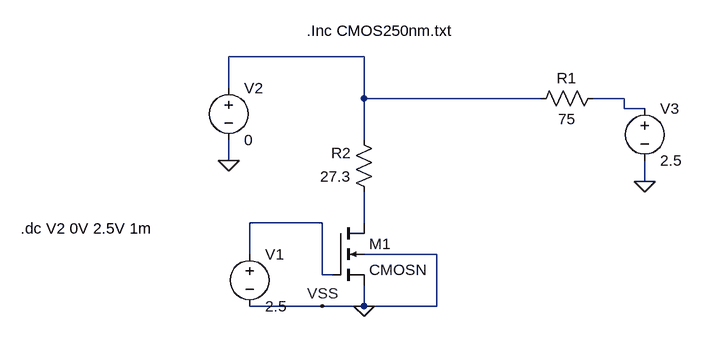
[diagram p0: schematic Draft4.asc]
Draft4.asc, the LTspice schematic file:
Version 4.1
SHEET 1 1112 680
WIRE 400 -32 192 -32
WIRE 192 16 192 -32
WIRE 400 32 400 -32
WIRE 672 32 400 32
WIRE 800 32 752 32
WIRE 800 48 800 32
WIRE 832 48 800 48
WIRE 400 96 400 32
WIRE 192 128 192 96
WIRE 832 160 832 128
WIRE 336 224 224 224
WIRE 400 224 400 176
WIRE 224 272 224 224
WIRE 512 272 400 272
WIRE 336 304 336 224
WIRE 352 304 336 304
WIRE 336 352 224 352
WIRE 400 352 400 320
WIRE 400 352 336 352
WIRE 512 352 512 272
WIRE 512 352 400 352
FLAG 336 352 VSS
FLAG 400 352 0
FLAG 192 128 0
FLAG 832 160 0
SYMBOL nmos4 352 224 R0
SYMATTR InstName M1
SYMATTR Value CMOSN
SYMATTR Value2 l=1u w=100u
SYMBOL voltage 224 256 R0
WINDOW 123 0 0 Left 0
WINDOW 39 0 0 Left 0
SYMATTR InstName V1
SYMATTR Value 2.5
SYMBOL voltage 192 0 R0
WINDOW 123 0 0 Left 0
WINDOW 39 0 0 Left 0
SYMATTR InstName V2
SYMATTR Value 0
SYMBOL res 768 16 R90
WINDOW 0 0 56 VBottom 2
WINDOW 3 32 56 VTop 2
SYMATTR InstName R1
SYMATTR Value 75
SYMBOL voltage 832 32 R0
WINDOW 123 0 0 Left 0
WINDOW 39 0 0 Left 0
SYMATTR InstName V3
SYMATTR Value 2.5
SYMBOL res 416 192 R180
WINDOW 0 36 76 Left 2
WINDOW 3 36 40 Left 2
SYMATTR InstName R2
SYMATTR Value 27.3
TEXT 312 -72 Left 2 !.Inc CMOS250nm.txt
TEXT -128 232 Left 2 !.dc V2 0V 2.5V 1m

The netlist it stands for:
* Draft4.asc
M1 N004 N003 0 0 CMOSN l=1u w=100u
V1 N003 0 2.5
V2 N001 0 0
R1 N002 N001 75
V3 N002 0 2.5
R2 N004 N001 27.3
.model NMOS NMOS
.model PMOS PMOS
.lib standard.mos
.Inc CMOS250nm.txt
.dc V2 0V 2.5V 1m
.backanno
.end

* Results of the author's LTspice run, read from the files saved beside the schematic
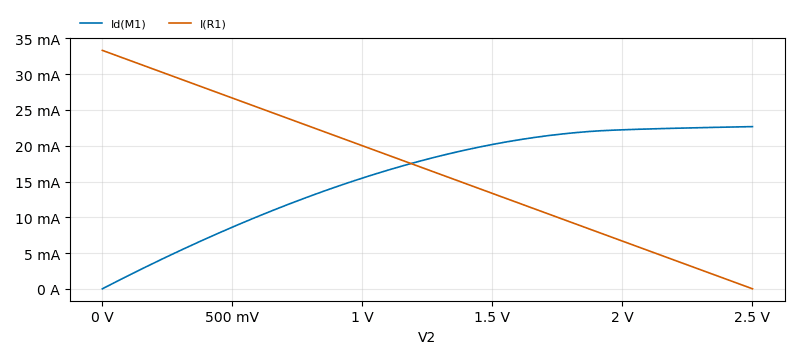
[diagram p1: DC transfer characteristic of Draft4.asc, plotted from the saved traces]
* DC transfer characteristic, 1 run:
*   Id(M1): 1.15e-18 fA at V2=0 V, 22.67 mA at V2=2.5 V, min 1.15e-18 fA, max 22.67 mA
*   I(R1): 33.33 mA at V2=0 V, 0 A at V2=2.5 V, min 0 A, max 33.33 mA